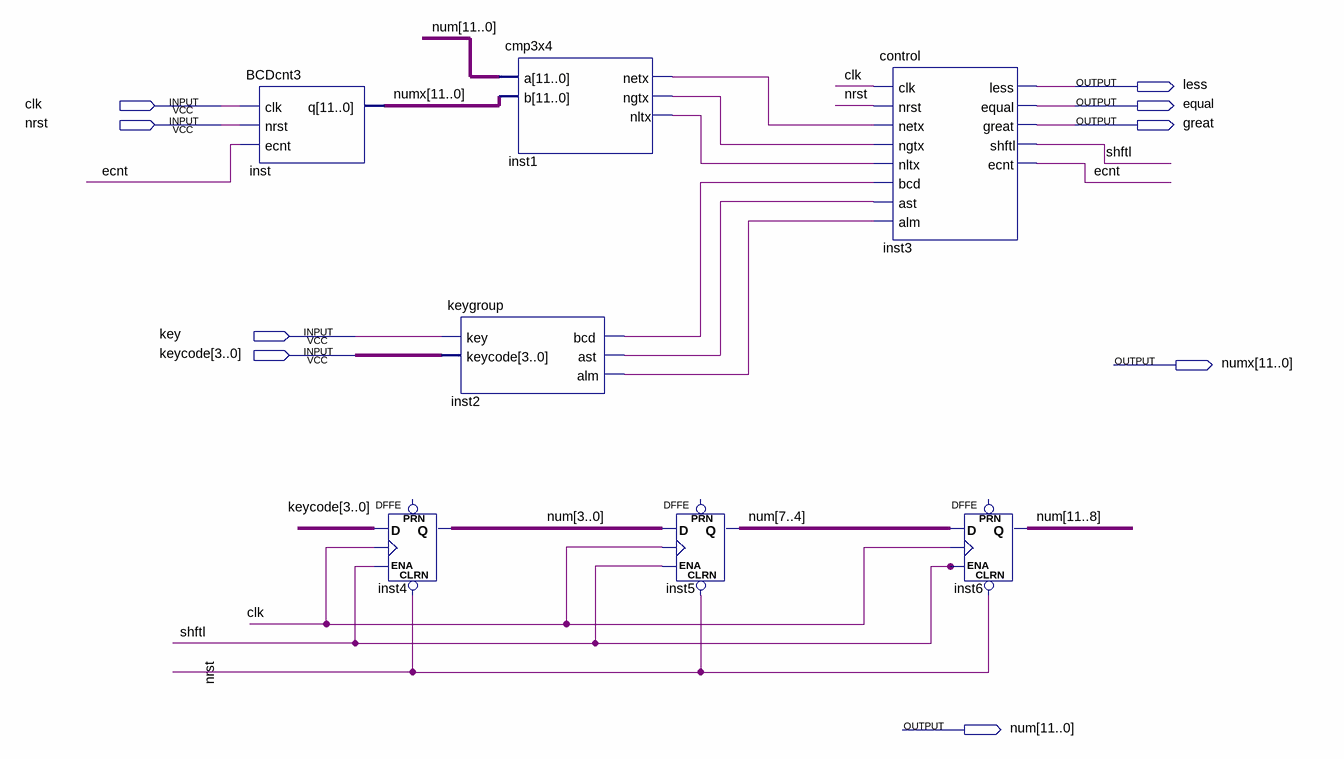
[diagram p0: schematic sheet]
// Quartus schematic tutorial3.bdf as structural Verilog: 7 symbols, 9 pins
module tutorial3 (
  input  clk,
  input  nrst,
  input  key,
  input  [3:0] keycode,
  output less,
  output equal,
  output great,
  output [11:0] numx,
  output [11:0] num
);

  wire ecnt, inst1_netx, inst1_ngtx, inst1_nltx, inst2_alm, inst2_ast, inst2_bcd, shftl;

  BCDcnt3 inst (.clk(clk), .nrst(nrst), .ecnt(ecnt), .q(numx));
  DFFE inst4[3:0] (.CLRN(nrst), .D(keycode), .CLK(clk), .ENA(shftl), .Q(num[3:0]));  // open: PRN
  cmp3x4 inst1 (.a(num), .b(numx), .netx(inst1_netx), .ngtx(inst1_ngtx), .nltx(inst1_nltx));
  keygroup inst2 (.key(key), .keycode(keycode), .bcd(inst2_bcd), .ast(inst2_ast), .alm(inst2_alm));
  DFFE inst5[3:0] (.CLRN(nrst), .D(num[3:0]), .CLK(clk), .ENA(shftl), .Q(num[7:4]));  // open: PRN
  control inst3 (
    .clk(clk), .nrst(nrst), .netx(inst1_netx), .ngtx(inst1_ngtx), .nltx(inst1_nltx), .bcd(inst2_bcd),
    .ast(inst2_ast), .alm(inst2_alm), .less(less), .equal(equal), .great(great), .shftl(shftl), .ecnt(ecnt));
  DFFE inst6[3:0] (.CLRN(nrst), .D(num[7:4]), .CLK(clk), .ENA(shftl), .Q(num[11:8]));  // open: PRN
endmodule
